# EasyEDA Pro project 集成板.eprj, board 平推转线板3.1.1(国赛)
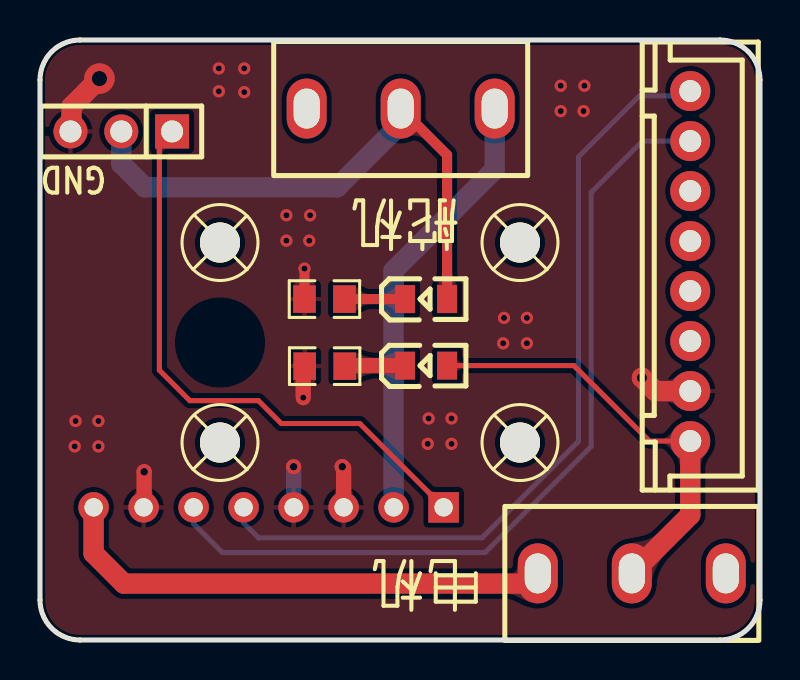
[diagram p14: board, top side]
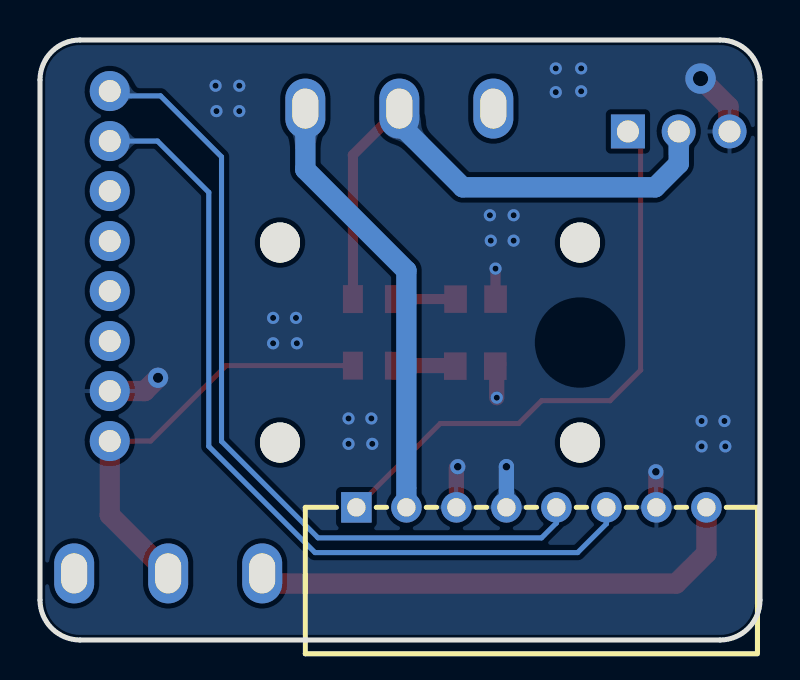
[diagram p15: board, bottom side, seen from below]

Outline 36 x 30 mm; copper layers: Top Layer, Bottom Layer. Coordinates in mm from the lower left corner of the outline.
Outline path: 0,28 0,2 arc(0.59,0.59) 2,0 34,0 arc(35.41,0.59) 36,2 36,28 arc(35.41,29.41) 34,30 2,30 arc(0.59,29.41) 0,28
Stack: Top Layer 0.035mm / Dielectric1 1.51mm FR4 er 4.5 / Bottom Layer 0.035mm

## Design rules (mm)
template: JLCPCB Capability(Two Layers Board)
spacing copperThickness1oz (default): track to track 0.102, other pairs 0.152 to 0.3
spacing copperThickness2oz: track to track 0.203, other pairs 0.152 to 0.3
track width copperThickness1oz (default): min 0.127, default 0.254, max 2.54
track width copperThickness2oz: min 0.203, default 0.254, max 2.54
differential pair differentialPair (default): width min 0.127, default 0.254, max 2.54; gap min 0.152, default 0.152
via viaSize (default): diameter min 0.5, default 0.61, max 10; hole min 0.3, default 0.305, max 6.3

## Placement (name value [footprint] x y rotation side)
LED12  NCD0805G1  [LED0805-R-RD]  19.3 13.72 0 top
LED13  NCD0805G1  [LED0805-R-RD]  19.3 17.05 0 top
M11  ZX-XH2.54-8PZZ  [CONN-TH_8P-P2.50-XH2.54-8P]  32.51 18.7 90 top
M12  ZX-XH2.54-8PWZ  [CONN-TH_8P-P2.50_ZX-XH2.54-8PWZ]  11.43 6.63 180 bottom
R14  3kΩ  [R0805]  14.23 13.69 0 top
R15  3kΩ  [R0805]  14.22 17.05 0 top
SCREW1  -  [M2螺丝]  9 19.87 0 top
SCREW2  -  [M2螺丝]  24 19.87 0 top
SCREW3  -  [M2螺丝]  9 9.87 0 top
SCREW4  -  [M2螺丝]  24 9.87 0 top
SW2  SS-12D10L5  [SW-TH_SS-12D10L5]  29.59 3.33 0 top
SW3  SS-12D10L5  [SW-TH_SS-12D10L5]  18.03 26.57 180 top
U36  HB-PH3-25413PB2GOP  [HDR-TH_3P-P2.54-V-M]  4.06 25.43 180 top

## Footprints (pads in the part's own frame, mm; a bottom-side part is the same pattern mirrored in y, then rotated)
CONN-TH_8P-P2.50-XH2.54-8P
  round 2 hole 1.1: 1(8.75,0) 2(6.25,0) 3(3.75,0) 4(1.25,0) 5(-1.25,0) 6(-3.75,0) 7(-6.25,0) 8(-8.75,0)
CONN-TH_8P-P2.50_ZX-XH2.54-8PWZ
  rect 1.524x1.524 hole 0.914: 1(-8.75,0)
  round 1.524 hole 0.914: 2(-6.25,0) 3(-3.75,0) 4(-1.25,0) 5(1.25,0) 6(3.75,0) 7(6.25,0) 8(8.75,0)
HDR-TH_3P-P2.54-V-M
  rect 1.7x1.7 hole 1.1: 1(-2.54,0)
  round 1.7 hole 1.1: 2(0,0) 3(2.54,0)
LED0805-R-RD
  rect 1x1.399 smd: 1(1.05,0) 2(-1.05,0)
M2螺丝
  round 2 hole 2: 1(0,0)
R0805
  rect 1.133x1.377 smd: 1(-1,0) 2(1,0)
SW-TH_SS-12D10L5
  oval 2x3 hole 1.3x2: 1(-4.7,0) 2(0,0) 3(4.7,0)

## Nets
As in the schematic.

Pads without a net: M11 3 4 5 6; SCREW1 1; SCREW2 1; SCREW3 1; SCREW4 1; SW2 3; SW3 3

## Via types
v1: diameter 0.61, hole 0.305, Top Layer to Bottom Layer, 26 vias
v2: diameter 0.762, hole 0.381, Top Layer to Bottom Layer, 3 vias
v3: diameter 1.016, hole 0.508, Top Layer to Bottom Layer, 1 via
v4: diameter 1.524, hole 0.762, Top Layer to Bottom Layer, 1 via

## Routing (per net, layer and track width the routed paths; a pad name or vN(x,y) marks a point on that pad's centre or on a via; arc(x,y) is an arc through that point)
8.4V: length 28.6
  Top Layer w0.508: LED13.1 20.35,24.25 SW3.2
  Bottom Layer w1.016: U36.2 4.06,23.81 5.24,22.63 14.86,22.63 18.03,25.81 SW3.2
8.4V0: length 22
  Bottom Layer w1.016: SW3.1 22.73,23.52 17.68,18.47 M12.2
12V: length 25.3
  Top Layer w1.016: SW2.1 24.38,2.82 4.19,2.82 2.68,4.33 M12.8
12V6: length 21.5
  Top Layer w0.254: LED12.1 26.69,13.72 30.47,9.95 M11.8
  Top Layer w1.016: M11.8 32.51,6.25 SW2.2
GND: length 15.1
  Top Layer w0.508: R15.1 v1(13.22,18.57)
  Top Layer w0.762: M12.3 15.18,8.6 v2(15.11,8.66) ; 13.06,13.79 13.16,13.69 v1(13.16,12.12) ; v2(5.21,8.41) 5.21,6.66 M12.7
  Top Layer w1.016: 1.58,25.36 1.58,26.67 v4(2.97,28.07) ; M11.7 30.76,12.45 v3(30.1,13.11)
  Bottom Layer w0.762: M12.4 v2(12.68,8.66)
  vias: v1(1.73,9.68) v1(1.78,10.95) v1(2.92,10.95) v1(2.92,9.68) v1(8.94,28.58) v1(8.94,27.44) v1(10.21,28.58) v1(10.21,27.39) v1(12.32,21.24) v1(12.32,19.97) v1(13.51,21.24) v1(13.46,19.97) v1(19.43,11.08) v1(19.39,9.81) v1(20.57,11.08) v1(20.57,9.81) v1(23.2,16.11) v1(23.16,14.84) v1(24.34,16.11) v1(24.34,14.84) v1(26.03,27.71) v1(26.03,26.44) v1(27.22,27.71) v1(27.18,26.44)
CAN_H: length 42.2
  Bottom Layer w0.254: M12.6 7.68,5.81 9.12,4.37 22.25,4.37 27.56,9.68 27.56,22.38 30.13,24.95 M11.2
CAN_L: length 41
  Bottom Layer w0.254: M12.5 10.18,5.85 10.92,5.11 22.1,5.11 26.92,9.93 26.92,24.16 29.97,27.21 32.27,27.21 M11.1
PA1: length 29.3
  Top Layer w0.254: U36.1 5.97,24.79 5.97,13.49 7.49,11.97 10.92,11.97 12.06,10.82 15.99,10.82 M12.1
$1N1511: length 3
  Top Layer w0.762: LED12.2 15.26,13.72 R14.2
$1N2860: length 3
  Top Layer w0.508: R15.2 LED13.2

## Copper pours and planes (outline as drawn; the poured copper is in the pictures)
GND on Top Layer: -3.05,31.65 40,31.65 40,-1.5 -3.05,-1.5
GND on Top Layer: -0.76,32.03 51.69,32.03 51.69,2.31 -0.76,2.31
GND on Bottom Layer: -0.76,31.91 38.61,31.91 38.61,-2.64 -0.76,-2.64

Small or netless copper shapes (teardrops, artwork), in the pictures only: 23 on Top Layer, 9 on Bottom Layer

## Text on the board
Top Silkscreen Layer: GND | 舵机 | 电机
